# Altium project RA09N.PrjPcb
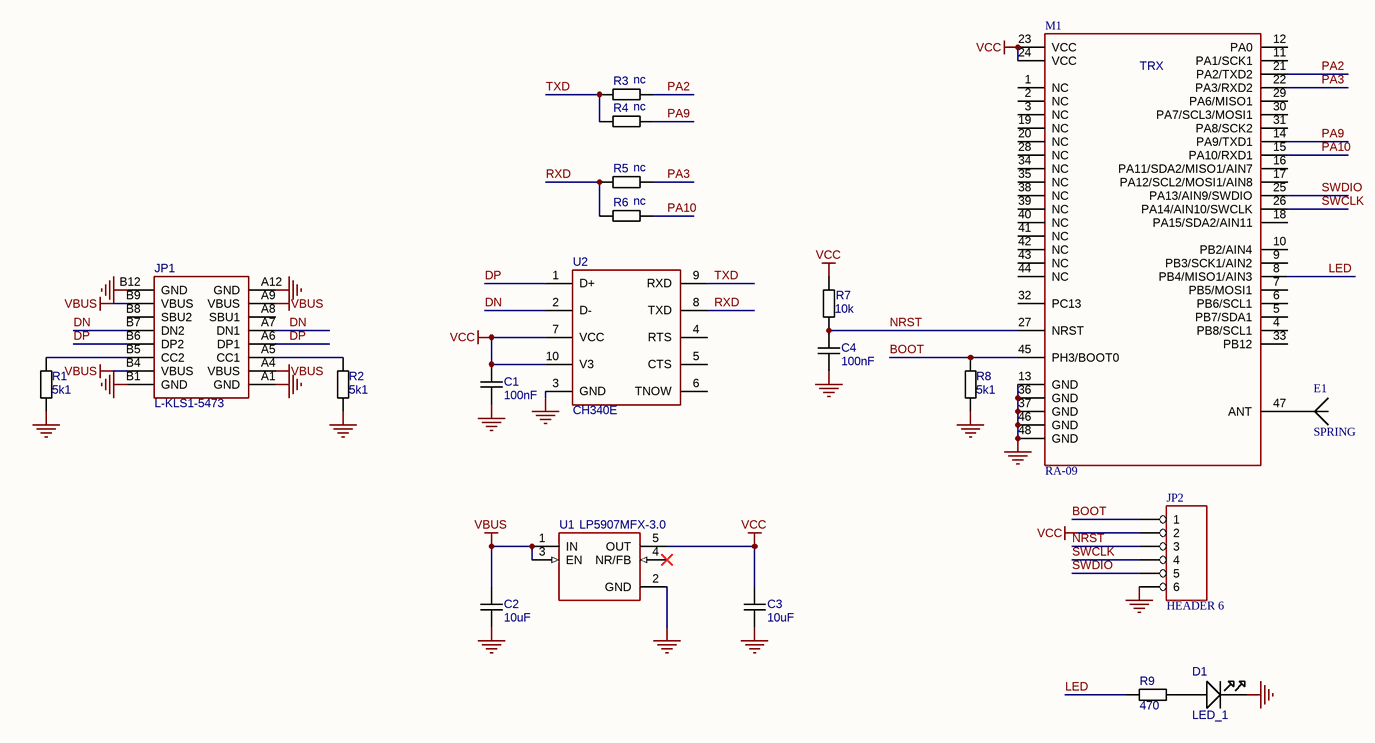
[diagram p0: RA09N.SchDoc]
1 sheet, 20 parts. Net scope: global (net labels, ports and power ports of the same name join across sheets).
Board file: RA09N.PcbDoc

## Sheet RA09N.SchDoc
size 431 x 279 mm; SheetNumber: 1; SheetTotal: 1

### Parts
C1  100nF  [C-0603]
C2  10uF  [C-0805]
C3  10uF  [C-0805]
C4  100nF  [C-0603]
D1  LED_1  [LED_0805]
E1  SPRING  [SPRING433]
JP1  L-KLS1-5473  [L-KLS1-5473]
JP2  HEADER 6  [CON6_2.54_SMD]
M1  RA-09  [RA09]
R1  5k1  [R-0603]
R2  5k1  [R-0603]
R3  nc  [R-0603]
R4  nc  [R-0603]
R5  nc  [R-0603]
R6  nc  [R-0603]
R7  10k  [R-0603]
R8  5k1  [R-0603]
R9  470  [R-0603]
U1  LP5907MFX-3.0  [SOT-23-5]
U2  CH340E  [MSOP-10]

### Nets
GND: C1.1 C2.2 C3.2 C4.1 D1.K(CATHODE) JP1.A1(GND) JP1.A12(GND) JP1.B1(GND) JP1.B12(GND) JP2.6 M1.13(GND) M1.36(GND) M1.37(GND) M1.46(GND) M1.48(GND) R1.2 R2.2 R8.2 U1.2(GND) U2.3(GND)
VBUS: C2.1 JP1.A4(VBUS) JP1.A9(VBUS) JP1.B4(VBUS) JP1.B9(VBUS) U1.1(IN) U1.3(EN)
VCC: C1.2 C3.1 JP2.2 M1.23(VCC) M1.24(VCC) R7.2 U1.5(OUT) U2.7(VCC) U2.10(V3)
BOOT: JP2.1 M1.45(PH3/BOOT0) R8.1
DN: JP1.A7(DN1) JP1.B7(DN2) U2.2(D-)
DP: JP1.A6(DP1) JP1.B6(DP2) U2.1(D+)
LED: M1.8(PB4/MISO1/AIN3) R9.2
NRST: C4.2 JP2.3 M1.27(NRST) R7.1
PA2: M1.21(PA2/TXD2) R3.1
PA3: M1.22(PA3/RXD2) R5.1
PA9: M1.14(PA9/TXD1) R4.1
PA10: M1.15(PA10/RXD1) R6.1
RXD: R5.2 R6.2 U2.8(TXD)
SWCLK: JP2.4 M1.26(PA14/AIN10/SWCLK)
SWDIO: JP2.5 M1.25(PA13/AIN9/SWDIO)
TXD: R3.2 R4.2 U2.9(RXD)
NetD1_A: D1.A(ANODE) R9.1
NetE1_1: E1.1 M1.47(ANT)
NetJP1_A5: JP1.A5(CC1) R2.1
NetJP1_B5: JP1.B5(CC2) R1.1

Not connected (* = marked no-connect by the designer): JP1 17(VSS) A8(SBU1) B8(SBU2); M1 1(NC) 2(NC) 3(NC) 4(PB8/SCL1) 5(PB7/SDA1) 6(PB6/SCL1) 7(PB5/MOSI1) 9(PB3/SCK1/AIN2) 10(PB2/AIN4) 11(PA1/SCK1) 12(PA0) 16(PA11/SDA2/MISO1/AIN7) 17(PA12/SCL2/MOSI1/AIN8) 18(PA15/SDA2/AIN11) 19(NC) 20(NC) 28(NC) 29(PA6/MISO1) 30(PA7/SCL3/MOSI1) 31(PA8/SCK2) 32(PC13) 33(PB12) 34(NC) 35(NC) 38(NC) 39(NC) 40(NC) 41(NC) 42(NC) 43(NC) 44(NC); U1 4(NR/FB)*; U2 4(RTS) 5(CTS) 6(TNOW)

### Notes on the sheet
- DWG. NO.
- REV.
- SHT.
- THIS DOCUMENT AND THE DATA DISCLOSED HEREIN OR HEREWITH IS THE PROPERTY OF ALTIUM LIMITED AND MAY BE FREELY DISTRIBUTED IN WHOLE. NO RIGHTS ARE RESERVED OR EXPRESS OR IMPLIED WARANTEE GIVEN.
- REVISION
- DESCRIPTION
- DATE
- APPROVED
- ENG:
- APPROVALS
- PROJECT
- DSN:
- CHK:
- REFERENCE DOCUMENTS
- PROJECT REVISION:
- TITLE
- DOCUMENT REVISION:
- DESIGN ITEM:
- BOM:
- FAB DWG:
- PCB DWG:
- ASSY DWG:
- SCALE:
- SIZE
- B
- CAGE CODE
- FILE NAME
- DWG NO.
- SHEET
- OF
- REV
- (in symbol RA-09) TRX

### Library data of the parts
C1-C4 = CAPN: Voltage: 50V; Точність/група: NP0; Вид: Конденсатор
D1 = LED_1: Вид: Світлодіод
E1 = ANT: Примітки: Пряма; Вид: Антена
JP1 = L-KLS1-5473: Mounting  Method: SMD; Value: *
JP2 = HEADER 6: Вид: Роз'єм; *: *
R1-R9 = RES: Точність/група: 5%; Вид: Резистор
U1 = LP5907: 250mA Low-Dropout Regulator; Вид: Мікросхема
U2 = CH340E: Value: {Value}; Mounting  Method: SMD